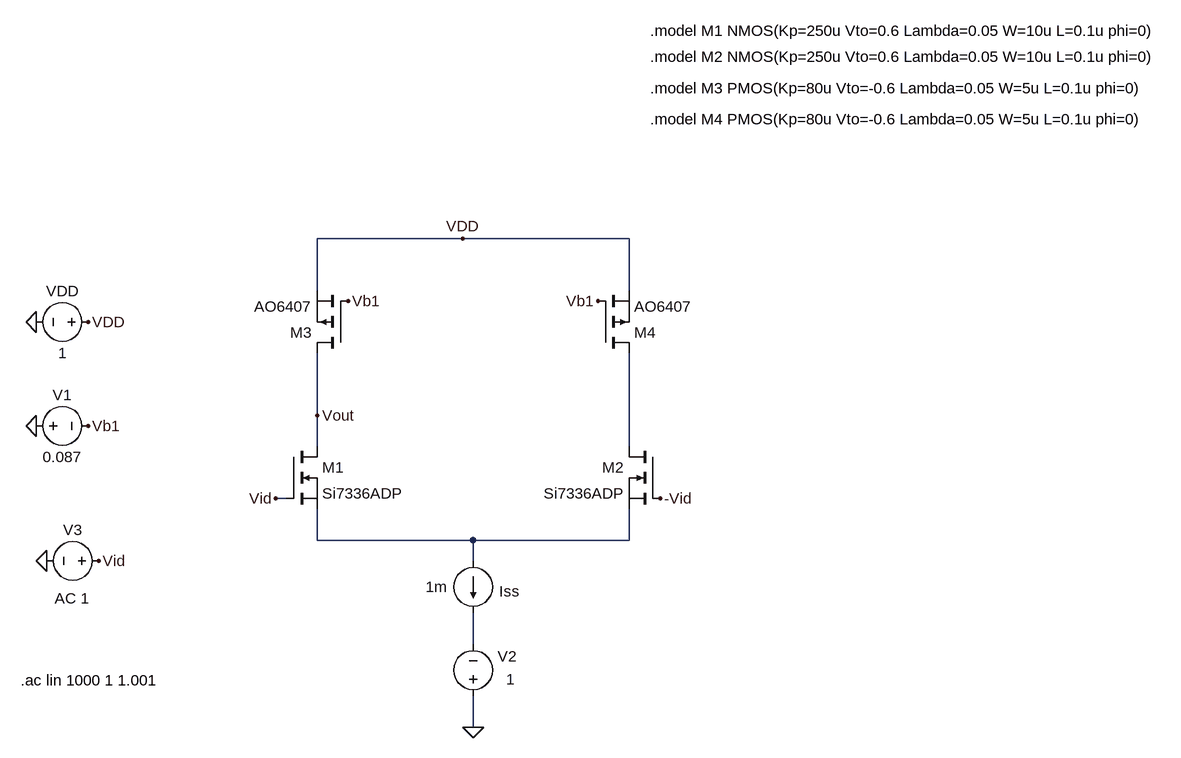
[diagram p0: schematic 2.asc]
2.asc, the LTspice schematic file:
Version 4
SHEET 1 1588 776
WIRE 432 -128 208 -128
WIRE 688 -128 432 -128
WIRE 208 -48 208 -128
WIRE 688 -48 688 -128
WIRE 208 144 208 48
WIRE 208 192 208 144
WIRE 688 192 688 48
WIRE 160 272 144 272
WIRE 208 336 208 288
WIRE 448 336 208 336
WIRE 688 336 688 288
WIRE 688 336 448 336
WIRE 448 368 448 336
WIRE 448 496 448 448
WIRE 448 624 448 576
FLAG -224 0 0
FLAG -144 0 VDD
FLAG 432 -128 VDD
FLAG -224 160 0
FLAG -144 160 Vb1
FLAG 256 -32 Vb1
FLAG 640 -32 Vb1
FLAG 448 624 0
FLAG -208 368 0
FLAG 736 272 -Vid
FLAG 144 272 Vid
FLAG -128 368 Vid
FLAG 208 144 Vout
SYMBOL nmos 160 192 R0
SYMATTR InstName M1
SYMATTR Value Si7336ADP
SYMBOL nmos 736 192 M0
SYMATTR InstName M2
SYMATTR Value Si7336ADP
SYMBOL pmos 256 48 R180
SYMATTR InstName M3
SYMATTR Value AO6407
SYMBOL pmos 640 48 M180
SYMATTR InstName M4
SYMATTR Value AO6407
SYMBOL voltage -128 0 R90
WINDOW 0 -32 56 VBottom 2
WINDOW 3 32 56 VTop 2
WINDOW 123 0 0 Left 0
WINDOW 39 0 0 Left 0
SYMATTR InstName VDD
SYMATTR Value 1
SYMBOL current 448 368 R0
WINDOW 0 40 47 Left 2
WINDOW 3 -73 40 Left 2
SYMATTR InstName Iss
SYMATTR Value 1m
SYMBOL voltage -240 160 R270
WINDOW 0 32 56 VTop 2
WINDOW 3 -32 56 VBottom 2
WINDOW 123 0 0 Left 0
WINDOW 39 0 0 Left 0
SYMATTR InstName V1
SYMATTR Value 0.087
SYMBOL voltage 448 592 R180
WINDOW 0 -67 77 Left 2
WINDOW 3 -64 42 Left 2
WINDOW 123 0 0 Left 0
WINDOW 39 0 0 Left 0
SYMATTR InstName V2
SYMATTR Value 1
SYMBOL voltage -112 368 R90
WINDOW 0 -32 56 VBottom 2
WINDOW 3 32 56 VTop 2
WINDOW 123 73 57 VBottom 2
WINDOW 39 0 0 Left 0
SYMATTR InstName V3
SYMATTR Value ""
SYMATTR Value2 AC 1
TEXT 720 -448 Left 2 !.model M1 NMOS(Kp=250u Vto=0.6 Lambda=0.05 W=10u L=0.1u phi=0)
TEXT 720 -408 Left 2 !.model M2 NMOS(Kp=250u Vto=0.6 Lambda=0.05 W=10u L=0.1u phi=0)
TEXT 720 -360 Left 2 !.model M3 PMOS(Kp=80u Vto=-0.6 Lambda=0.05 W=5u L=0.1u phi=0)
TEXT 720 -312 Left 2 !.model M4 PMOS(Kp=80u Vto=-0.6 Lambda=0.05 W=5u L=0.1u phi=0)
TEXT -248 552 Left 2 !.ac lin 1000 1 1.001

The netlist it stands for:
* 2.asc
M1 Vout Vid N002 N002 Si7336ADP
M2 N001 -Vid N002 N002 Si7336ADP
M3 Vout Vb1 VDD VDD AO6407
M4 N001 Vb1 VDD VDD AO6407
VDD VDD 0 1
Iss N002 N003 1m
V1 0 Vb1 0.087
V2 0 N003 1
V3 Vid 0 AC 1
.model NMOS NMOS
.model PMOS PMOS
.lib standard.mos
.model M1 NMOS(Kp=250u Vto=0.6 Lambda=0.05 W=10u L=0.1u phi=0)
.model M2 NMOS(Kp=250u Vto=0.6 Lambda=0.05 W=10u L=0.1u phi=0)
.model M3 PMOS(Kp=80u Vto=-0.6 Lambda=0.05 W=5u L=0.1u phi=0)
.model M4 PMOS(Kp=80u Vto=-0.6 Lambda=0.05 W=5u L=0.1u phi=0)
.ac lin 1000 1 1.001
.backanno
.end